# Altium project ElettronicaDiControllo.PrjPcb
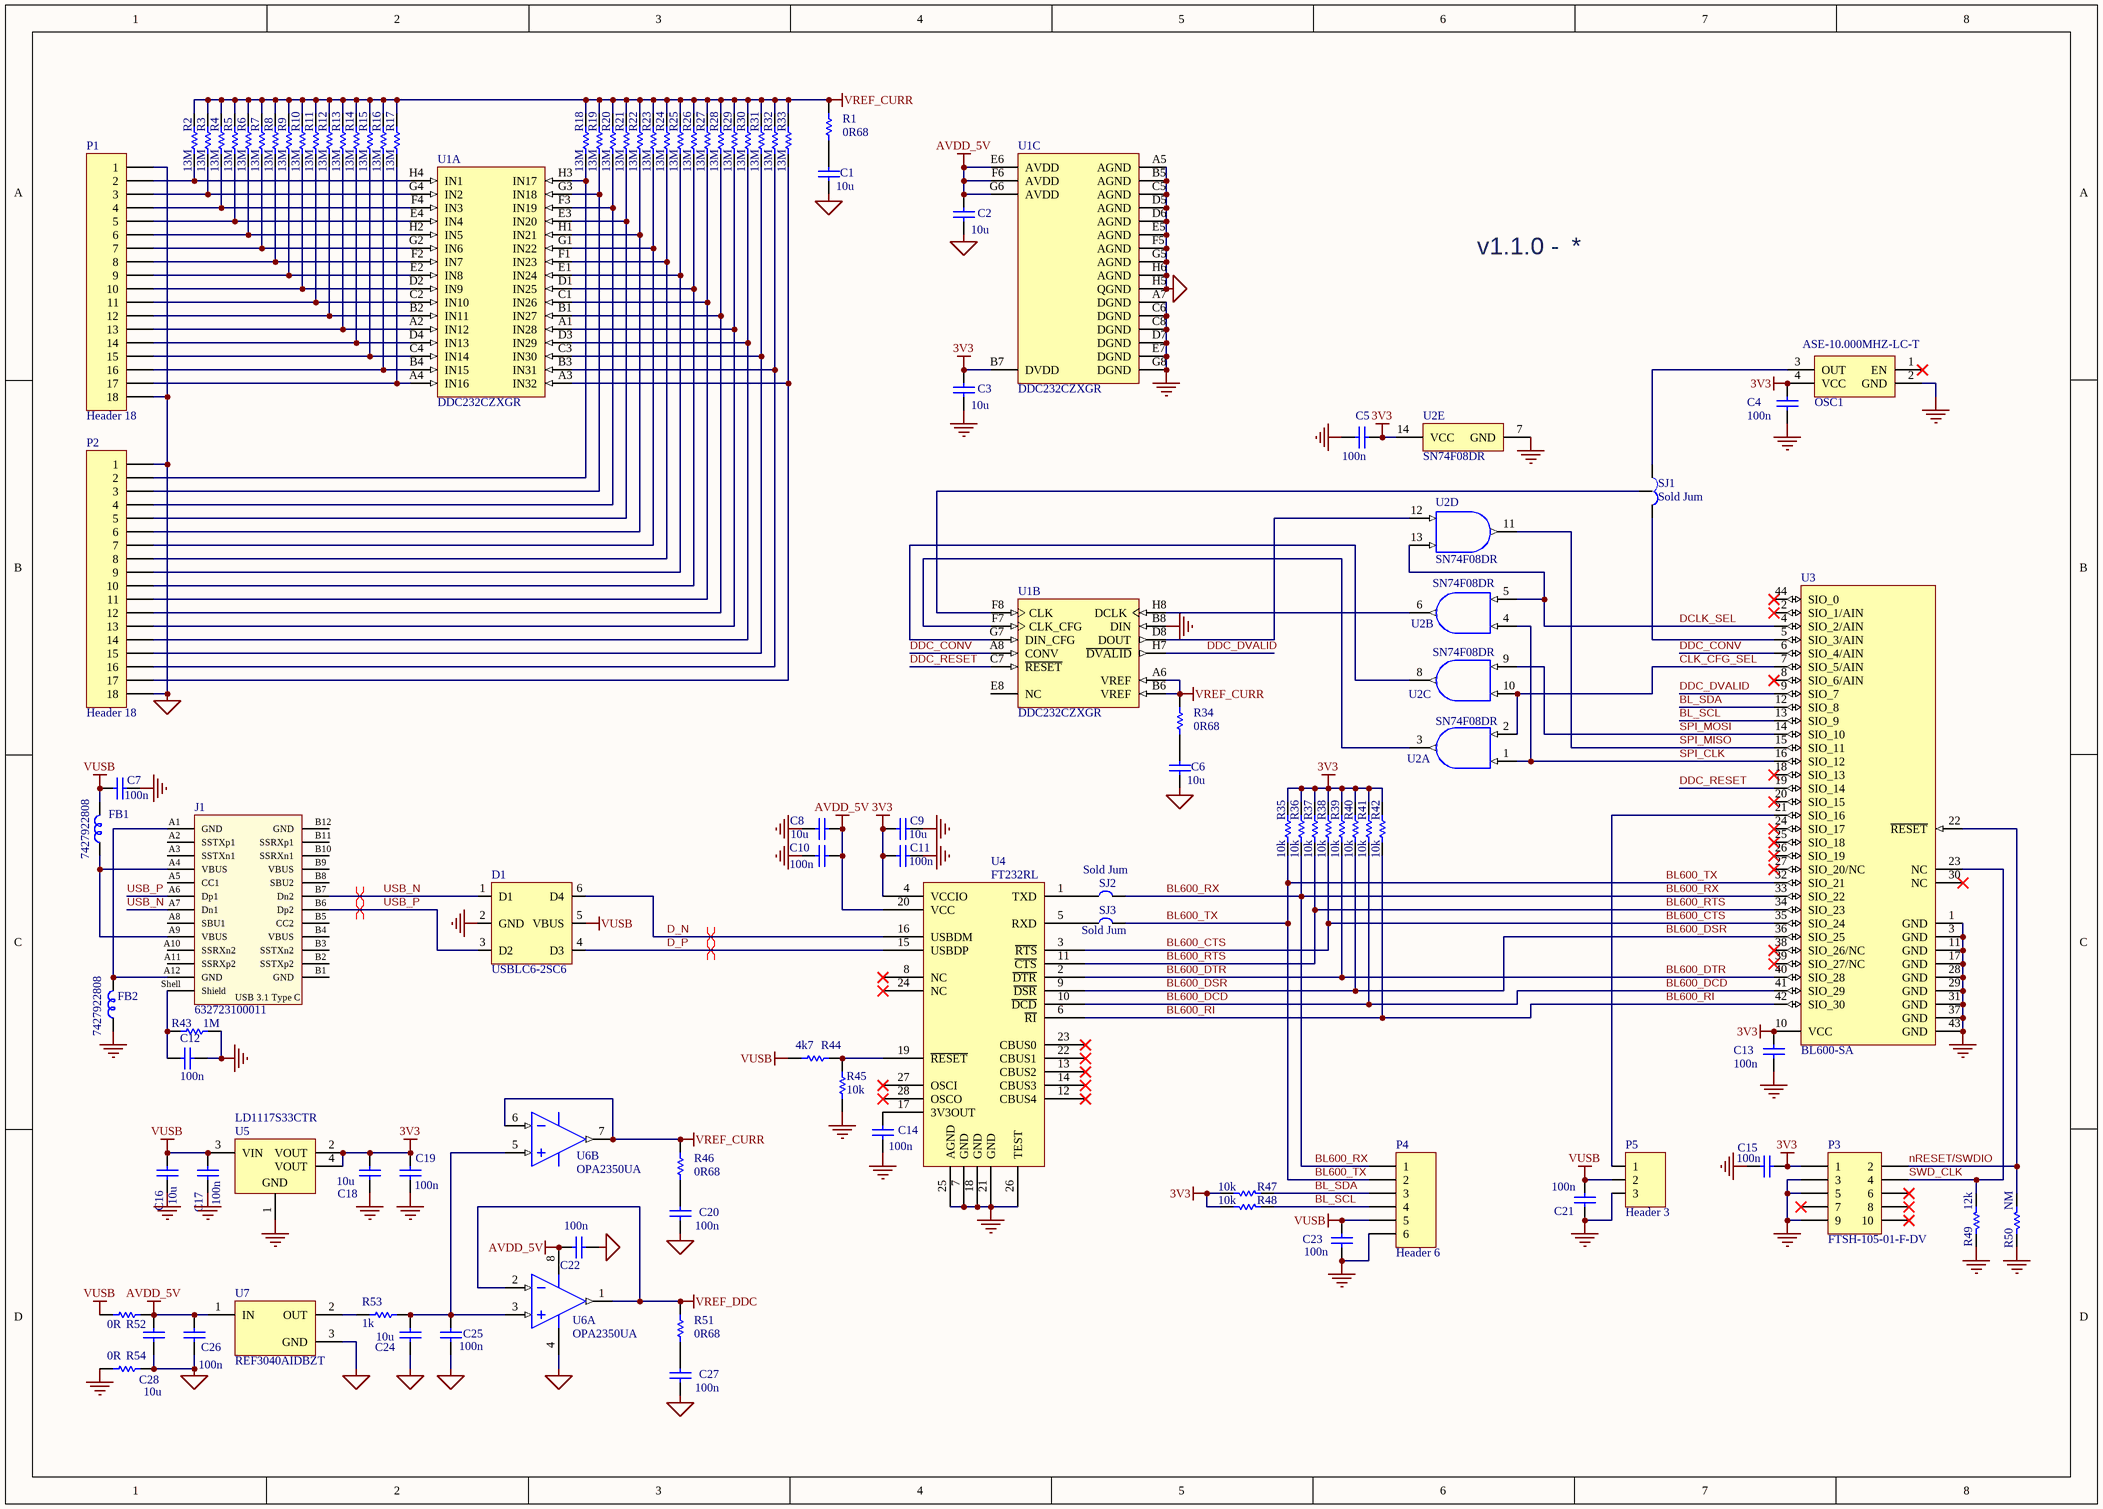
[diagram p0: ElettronicaDiControllo.SchDoc]
1 sheet, 102 parts. Net scope: global (net labels, ports and power ports of the same name join across sheets).

## Sheet ElettronicaDiControllo.SchDoc
size A3

### Parts
C1  10u  [0603]
C2  10u  [0603]
C3  10u  [0603]
C4  100n  [0603]
C5  100n  [0603]
C6  10u  [0603]
C7  100n  [0603]
C8  10u  [0603]
C9  10u  [0603]
C10  100n  [0603]
C11  100n  [0603]
C12  100n  [0603]
C13  100n  [0603]
C14  100n  [0603]
C15  100n  [0603]
C16  10u  [0603]
C17  100n  [0603]
C18  10u  [0603]
C19  100n  [0603]
C20  100n  [0603]
C21  100n  [0603]
C22  100n  [0603]
C23  100n  [0603]
C24  10u  [0603]
C25  100n  [0603]
C26  100n  [0603]
C27  100n  [0603]
C28  10u  [0603]
D1  USBLC6-2SC6  [SOT23-6]
FB1  7427922808  [0603]
FB2  7427922808  [0603]
J1  632723100011  [632723100011]
OSC1  ASE-10.000MHZ-LC-T  [XTAL_SMD3225]
P1  Header 18  [HDR1X18]
P2  Header 18  [HDR1X18]
P3  FTSH-105-01-F-DV  [FTSH-105-01-F-DV-K]
P4  Header 6  [HDR1X6]
P5  Header 3  [HDR1X3]
R1  0R68  [0603]
R2  13M  [0603]
R3  13M  [0603]
R4  13M  [0603]
R5  13M  [0603]
R6  13M  [0603]
R7  13M  [0603]
R8  13M  [0603]
R9  13M  [0603]
R10  13M  [0603]
R11  13M  [0603]
R12  13M  [0603]
R13  13M  [0603]
R14  13M  [0603]
R15  13M  [0603]
R16  13M  [0603]
R17  13M  [0603]
R18  13M  [0603]
R19  13M  [0603]
R20  13M  [0603]
R21  13M  [0603]
R22  13M  [0603]
R23  13M  [0603]
R24  13M  [0603]
R25  13M  [0603]
R26  13M  [0603]
R27  13M  [0603]
R28  13M  [0603]
R29  13M  [0603]
R30  13M  [0603]
R31  13M  [0603]
R32  13M  [0603]
R33  13M  [0603]
R34  0R68  [0603]
R35  10k  [0603]
R36  10k  [0603]
R37  10k  [0603]
R38  10k  [0603]
R39  10k  [0603]
R40  10k  [0603]
R41  10k  [0603]
R42  10k  [0603]
R43  1M  [0603]
R44  4k7  [0603]
R45  10k  [0603]
R46  0R68  [0603]
R47  10k  [0603]
R48  10k  [0603]
R49  12k  [0603]
R50  NM  [0603]
R51  0R68  [0603]
R52  0R  [0603]
R53  1k  [0603]
R54  0R  [0603]
SJ1  Sold Jum  [Solder_j2]
SJ2  Sold Jum  [Solder_j]
SJ3  Sold Jum  [Solder_j]
U1  DDC232CZXGR  [TI-ZXG64]  (parts A,B,C of 3)
U2  SN74F08DR  [D0014A_N]  (parts A,B,C,D,E of 5)
U3  BL600-SA  [LIRD-BL600-SA_V]
U4  FT232RL  [TSSOP28-W]
U5  LD1117S33CTR  [SOT-223_N]
U6  OPA2350UA  [D0008A_L]  (parts A,B of 2)
U7  REF3040AIDBZT  [DBZ0003A_M]

### Nets
3V3: C3.2 C4.1 C5.2 C9.1 C11.1 C13.1 C15.1 C18.1 C19.1 OSC1.4(VCC) P3.1 R35.2 R36.2 R37.2 R38.2 R39.2 R40.2 R41.2 R42.2 R47.2 R48.2 U1.B7(DVDD) U2.14(VCC) U3.10(VCC) U4.4(VCCIO) U5.2(VOUT) U5.4(VOUT)
AGND: C1.2 C2.1 C6.2 C20.2 C22.2 C24.2 C25.2 C26.2 C27.2 C28.2 P1.1 P1.18 P2.1 P2.18 R54.1 U1.A5(AGND) U1.B5(AGND) U1.C5(AGND) U1.D5(AGND) U1.D6(AGND) U1.E5(AGND) U1.F5(AGND) U1.G5(AGND) U1.H5(QGND) U1.H6(AGND) U6.4(V-) U7.3(GND)
AVDD_5V: C2.2 C8.1 C10.1 C22.1 C26.1 C28.1 R52.1 U1.E6(AVDD) U1.F6(AVDD) U1.G6(AVDD) U4.20(VCC) U6.8(V+) U7.1(IN)
GND: C3.1 C4.2 C5.1 C7.2 C8.2 C9.2 C10.2 C11.2 C12.2 C13.2 C14.1 C15.2 C16.2 C17.2 C18.2 C19.2 C21.2 C23.2 D1.2(GND) FB2.2 OSC1.2(GND) P3.3 P3.5 P3.9 P4.6 P5.3 R43.1 R45.2 R49.2 R50.2 R54.2 U1.A7(DGND) U1.B8(DIN) U1.C6(DGND) U1.C8(DGND) U1.D7(DGND) U1.E7(DGND) U1.G8(DGND) U2.7(GND) U3.1(GND) U3.3(GND) U3.11(GND) U3.17(GND) U3.28(GND) U3.29(GND) U3.31(GND) U3.37(GND) U3.43(GND) U4.7(GND) U4.18(GND) U4.21(GND) U4.25(AGND) U4.26(TEST) U5.1(GND)
VREF_CURR: R1.2 R2.2 R3.2 R4.2 R5.2 R6.2 R7.2 R8.2 R9.2 R10.2 R11.2 R12.2 R13.2 R14.2 R15.2 R16.2 R17.2 R18.2 R19.2 R20.2 R21.2 R22.2 R23.2 R24.2 R25.2 R26.2 R27.2 R28.2 R29.2 R30.2 R31.2 R32.2 R33.2 R34.2 R46.2 U1.A6(VREF) U1.B6(VREF) U6.6(IN_B-) U6.7(OUT_B)
VREF_DDC: R51.2 U6.1(OUT_A) U6.2(IN_A-)
VUSB: C7.1 C16.1 C17.1 C21.1 C23.1 D1.5(VBUS) FB1.1 P4.5 P5.2 R44.2 R52.2 U5.3(VIN)
BL600_CTS: R38.1 U3.35(SIO_24) U4.3(~{RTS})
BL600_DCD: R41.1 U3.41(SIO_29) U4.10(~{DCD})
BL600_DSR: R40.1 U3.36(SIO_25) U4.9(~{DSR})
BL600_DTR: R39.1 U3.40(SIO_28) U4.2(~{DTR})
BL600_RI: R42.1 U3.42(SIO_30) U4.6(~{RI})
BL600_RTS: R37.1 U3.34(SIO_23) U4.11(~{CTS})
BL600_RX: P4.1 R36.1 SJ2.1 U3.33(SIO_22)
BL600_TX: P4.2 R35.1 SJ3.1 U3.32(SIO_21)
BL_SCL: P4.4 R48.1 U3.13(SIO_9)
BL_SDA: P4.3 R47.1 U3.12(SIO_8)
CLK_CFG_SEL: U2.2(1B) U2.10(3B) U3.7(SIO_5/AIN)
D_N: D1.6(D4) U4.16(USBDM)
D_P: D1.4(D3) U4.15(USBDP)
DCLK_SEL: U2.5(2B) U2.13(4B) U3.4(SIO_2/AIN)
DDC_CONV: U1.A8(CONV) U3.6(SIO_4/AIN)
DDC_DVALID: U1.H7(~{DVALID}) U3.9(SIO_7)
DDC_RESET: U1.C7(~{RESET}) U3.19(SIO_14)
nRESET/SWDIO: P3.2 R50.1 U3.22(~{RESET})
SPI_CLK: U2.1(1A) U2.4(2A) U3.16(SIO_12)
SPI_MISO: U2.11(4Y) U3.15(SIO_11)
SPI_MOSI: U2.9(3A) U3.14(SIO_10)
SWD_CLK: P3.4 R49.1 U3.23(NC)
USB_N: D1.1(D1) J1.A7(Dn1) J1.B7(Dn2)
USB_P: D1.3(D2) J1.A6(Dp1) J1.B6(Dp2)
NetC1_1: C1.1 R1.1
NetC6_1: C6.1 R34.1
NetC12_1: C12.1 J1.Shell(Shield) R43.2
NetC14_2: C14.2 U4.17(3V3OUT)
NetC20_1: C20.1 R46.1
NetC24_1: C24.1 C25.1 R53.1 U6.3(IN_A+) U6.5(IN_B+)
NetC27_1: C27.1 R51.1
NetFB1_2: FB1.2 J1.A4(VBUS) J1.A9(VBUS)
NetFB2_1: FB2.1 J1.A1(GND) J1.A12(GND)
NetOSC1_3: OSC1.3(OUT) SJ1.3
NetP1_2: P1.2 R2.1 U1.H4(IN1)
NetP1_3: P1.3 R3.1 U1.G4(IN2)
NetP1_4: P1.4 R4.1 U1.F4(IN3)
NetP1_5: P1.5 R5.1 U1.E4(IN4)
NetP1_6: P1.6 R6.1 U1.H2(IN5)
NetP1_7: P1.7 R7.1 U1.G2(IN6)
NetP1_8: P1.8 R8.1 U1.F2(IN7)
NetP1_9: P1.9 R9.1 U1.E2(IN8)
NetP1_10: P1.10 R10.1 U1.D2(IN9)
NetP1_11: P1.11 R11.1 U1.C2(IN10)
NetP1_12: P1.12 R12.1 U1.B2(IN11)
NetP1_13: P1.13 R13.1 U1.A2(IN12)
NetP1_14: P1.14 R14.1 U1.D4(IN13)
NetP1_15: P1.15 R15.1 U1.C4(IN14)
NetP1_16: P1.16 R16.1 U1.B4(IN15)
NetP1_17: P1.17 R17.1 U1.A4(IN16)
NetP2_2: P2.2 R18.1 U1.H3(IN17)
NetP2_3: P2.3 R19.1 U1.G3(IN18)
NetP2_4: P2.4 R20.1 U1.F3(IN19)
NetP2_5: P2.5 R21.1 U1.E3(IN20)
NetP2_6: P2.6 R22.1 U1.H1(IN21)
NetP2_7: P2.7 R23.1 U1.G1(IN22)
NetP2_8: P2.8 R24.1 U1.F1(IN23)
NetP2_9: P2.9 R25.1 U1.E1(IN24)
NetP2_10: P2.10 R26.1 U1.D1(IN25)
NetP2_11: P2.11 R27.1 U1.C1(IN26)
NetP2_12: P2.12 R28.1 U1.B1(IN27)
NetP2_13: P2.13 R29.1 U1.A1(IN28)
NetP2_14: P2.14 R30.1 U1.D3(IN29)
NetP2_15: P2.15 R31.1 U1.C3(IN30)
NetP2_16: P2.16 R32.1 U1.B3(IN31)
NetP2_17: P2.17 R33.1 U1.A3(IN32)
NetP5_1: P5.1 U3.21(SIO_16)
NetR44_1: R44.1 R45.1 U4.19(~{RESET})
NetR53_2: R53.2 U7.2(OUT)
NetSJ1_1: SJ1.1 U3.5(SIO_3/AIN)
NetSJ1_2: SJ1.2 U1.F8(CLK)
NetSJ2_2: SJ2.2 U4.1(TXD)
NetSJ3_2: SJ3.2 U4.5(RXD)
NetU1_D8: U1.D8(DOUT) U2.12(4A)
NetU1_F7: U1.F7(CLK_CFG) U2.3(1Y)
NetU1_G7: U1.G7(DIN_CFG) U2.8(3Y)
NetU1_H8: U1.H8(DCLK) U2.6(2Y)

Not connected (* = marked no-connect by the designer): J1 A2(SSTXp1) A3(SSTXn1) A5(CC1) A8(SBU1) A10(SSRXn2) A11(SSRXp2) B1(GND) B2(SSTXp2) B3(SSTXn2) B4(VBUS) B5(CC2) B8(SBU2) B9(VBUS) B10(SSRXn1) B11(SSRXp1) B12(GND); OSC1 1(EN)*; P3 6* 7* 8* 10*; U1 E8(NC); U3 2(SIO_1/AIN)* 8(SIO_6/AIN)* 18(SIO_13)* 20(SIO_15)* 24(SIO_17)* 25(SIO_18)* 26(SIO_19)* 27(SIO_20/NC)* 30(NC)* 38(SIO_26/NC)* 39(SIO_27/NC)* 44(SIO_0)*; U4 8(NC)* 12(CBUS4)* 13(CBUS2)* 14(CBUS3)* 22(CBUS1)* 23(CBUS0)* 24(NC)* 27(OSCI)* 28(OSCO)*

### Layout directives
differential pair: D_N, D_P, USB_N, USB_P

### Notes on the sheet
- v1.1.0 -
- (in symbol 632723100011) USB 3.1 Type C

### Library data of the parts
C1-C28 = Cap 100nF: Capacitor; Published: 8-Jun-2000; LatestRevisionDate: 17-Jul-2002; LatestRevisionNote: Re-released for DXP Platform.; Publisher: Altium Limited
D1 = USBUF02W6: EMI filter and line termination for USB upstream ports; Supplier 1: Digi-Key; Supplier Part Number 1: 497-5235-1-ND; Supplier 2: Farnell; Supplier Part Number 2: 1269406
FB1 FB2 = Ferrite: Supplier 1: Digi-Key; Supplier Part Number 1: 732-6114-1-ND; Supplier 2: Farnell; Supplier Part Number 2: 2467183
J1 = 632723100011: USB 3.1 Type C Receptacle Horizontal THR WR-COM; Interface Type: Type C; Sub-Family: USB 3.1; ComponentLink1Description: Manufacturer; ComponentLink1URL: http://www.we-online.de; ComponentLink2Description: Datasheet; ComponentLink2URL: http://katalog.we-online.de/em/datasheet/632723x00011.pdf; Part Number: 632723100011; Published Date: April 2017; Publisher: Wurth Elektronik; Gender: Receptacle; Type: Horizontal; Construction: THR; Supplier 1: Digi-Key; Supplier 2: Farnell; Supplier Part Number 1: 732-9617-1-ND; Supplier Part Number 2: 2984360
OSC1 = Oscillatore: Supplier 1: Digi-Key; Supplier Part Number 1: 535-9559-1-ND; Supplier 2: Mouser; Supplier Part Number 2: 815-ASE10.000MHZLCT
P1 P2 = Header 18: Header, 18-Pin; LatestRevisionDate: 17-Jul-2002; LatestRevisionNote: Re-released for DXP Platform.; Publisher: Altium Limited
P3 = Header 5X2: Header, 5-Pin, Dual row; LatestRevisionDate: 17-Jul-2002; LatestRevisionNote: Re-released for DXP Platform.; Publisher: Altium Limited; Supplier 1: Digi-Key; Supplier Part Number 1: SAM13159CT-ND; Supplier 2: Mouser; Supplier Part Number 2: 200-FTSH10501FDVKPTR
P4 = Header 6: Header, 6-Pin; LatestRevisionDate: 17-Jul-2002; LatestRevisionNote: Re-released for DXP Platform.; Publisher: Altium Limited
P5 = Header 3: Non Montare; LatestRevisionDate: 17-Jul-2002; LatestRevisionNote: Re-released for DXP Platform.; Publisher: Altium Limited
R1-R42 R44-R48 R51-R54 = Res 1M: Resistor; Value: 1M; Published: 8-Jun-2000; Publisher: Altium Limited; LatestRevisionDate: 17-Jul-2002; LatestRevisionNote: Re-released for DXP Platform.; PackageReference: AXIAL-0.3; PackageDescription: Axial Device, Thru-Hole; 2 Leads; 0.3 in Pin Spacing
R43 = Res 1M: Resistor; Published: 8-Jun-2000; Publisher: Altium Limited; Value: 1M; LatestRevisionDate: 17-Jul-2002; LatestRevisionNote: Re-released for DXP Platform.; PackageReference: AXIAL-0.3; PackageDescription: Axial Device, Thru-Hole; 2 Leads; 0.3 in Pin Spacing
R49 R50 = Res 0R: Resistor; Value: 0; Fitted: NO; Published: 8-Jun-2000; Revision: July-2002: Re-released for DXP Platform.; Publisher: Altium Limited
SJ1 = SJ2: Double solder jumper
SJ2 SJ3 = SJ: Solder Jumper
U1 = CMP-0003-02178-1: 32 Channel Current-Input 20-Bit ADC, 0 to 70 degC, 64-pin BGA (ZXG64), Green (RoHS & no Sb/Br); Manufacturer: Texas Instruments; Resolution(Bits): 20; Analog Voltage AV/DD(Max)(V): 5.25; Digital Supply(Max)(V): 3.6; Architecture: Delta-Sigma; Digital Supply(Min)(V): 2.7; Sample Rate (max)(SPS): 3.125k; # Input Channels: 32; SubFamily: Low Power, 8-Bit, Dual 1.5 GSPS or Single 3.0 GSPS A/D Converter; Analog Voltage AV/DD(Min)(V): 4.75; ComponentLink3URL: http://www.ti.com/litv/pdf/mpbg581; ComponentLink1URL: http://www.ti.com/; ComponentLink2Description: Datasheet; PackageDescription: 64-Pin Plastic Ball Grid Array, Body 8 x 8 mm, Pitch 0.8 mm; ComponentLink2URL: http://www.ti.com/general/docs/lit/getliterature.tsp?genericPartNumber=DDC232&fileType=pdf; PartNumber: DDC232CZXGR; Eco-Plan: Green (RoHS & no Sb/Br); Mounting Technology: Surface Mount; PackageVersion: 4206838/A, 02/2005; PackageReference: ZXG64; ComponentLink1Description: Manufacturer URL; DatasheetVersion: SBAS331D; ComponentLink3Description: Package Specification
U2 = CMP-0777-00012-3: Quadruple 2-Input Positive-AND Gate, D0014A, LARGE T&R; Manufacturer: Texas Instruments; Output Drive (IOL/IOH)(Max)(mA): -9/9; Bits(#): 4; tpd @ Nom Voltage(Max)(ns): 6.6; VCC(Min)(V): 4.5; F @ Nom Voltage(Max)(Mhz): 70; Input Type: TTL; Rating: Catalog; Technology Family: F; Voltage(Nom)(V): 5; Schmitt Trigger: No; VCC(Max)(V): 5.5; DatasheetVersion: SDFS038A; Operating Temperature Range(C): 0 to 70; PackageReference: D0014A; Generic Part Number: SN74F08; Output Type: TTL
U3 = CMP-2000-05951-1: Single Mode Bluetooth Low Energy (BLE) Module Integrated Antenna, 1.8 to 3.6 V, -25 to 75 degC, 44-Pin SMD, RoHS, Tray; Manufacturer: Laird; Bluetooth Version: Bluetooth4.0; Data Rate: 1Mbps; Supply Voltage Max: 3.6V; Supply Voltage Min: 1.8V; SVHC: NoSVHC(17-Dec-2014); Product Range: BL600Series; Receive Sensitivity: -91dBm; Signal Range Max: 100m; Bluetooth Class: Class2; Package Reference: BL600-SA; Datasheet Version: Rev. 3.0, 04/2015; Operating Temperature Max: 75°C; Operating Temperature Min: -25°C; Datasheet URL: http://cdn.lairdtech.com/home/brandworld/files/BL600%20Hardware%20Integration%20Guide.pdf; Package Description: 44-Pin Surface Mount Device, Body 19 x 12.5 mm, Pitch 0.8 mm, Height 3.27 mm; Manufacturer URL: https://www.lairdtech.com/; Mounting Technology: SurfaceMount
U4 = FT232R: USB  to  serial  UART   interface; Supplier 1: Digi-Key; Supplier Part Number 1: 768-1007-1-ND; Supplier 2: Farnell; Supplier Part Number 2: 1146032
U5 = CMP-0244-00307-1: Fixed Low Drop Positive Voltage Regulator, 3.3V, 4-Pin SOT-223, Tape and Reel; ComponentLink1URL: http://www.st.com; PackageVersion: 2010; ComponentLink1Description: Manufacturer URL; DatasheetVersion: 1/11/2011; ComponentLink2URL: http://www.st.com/internet/com/TECHNICAL_RESOURCES/TECHNICAL_LITERATURE/DATASHEET/CD00000544.pdf; PackageReference: SOT-223; ComponentLink2Description: Datasheet; PackageDescription: 4-Pin SOT-223 Package, 6.5 x 3.5 mm Body, 2.3 mm Pitch, 7 mm Lead Span
U6 = CMP-0272-00729-3: High-Speed, Single-Supply, Rail-to-Rail Operational Amplifier MicroAmplifier(TM) Series, 2.7 to 5.5 V, -40 to 85 degC, 8-pin SOIC (D8), Green (RoHS & no Sb/Br); Manufacturer: Texas Instruments; Number of Channels: 2; Vio (25C)(Max)(mV): 1; Iq per channel(Max)(mA): 8.5; Total Supply Voltage(Min)(+5V is 5, +/-5V is 10): 2.7; Vn at 1kHz(Typ)(nV/rtHz): 18; IIB(Max)(pA): 10; Total Supply Voltage(Max)(+5V is 5, +/-5V is 10): 5.5; Sub Family: Low Input Bias Current Amp (<=10pA), Low Offset Voltage Amplifier (<=500uV), Low Supply Voltage Amplifier (<=2.7V), Precision Amplifier; Offset Drift(Typ)(uV/C): 4; CMRR(Min)(dB): 74; Slew Rate(Typ)(V/us): 22; Mounting Technology: Surface Mount; Eco-Plan: Green (RoHS & no Sb/Br); ComponentLink2URL: http://www.ti.com/general/docs/lit/getliterature.tsp?genericPartNumber=OPA2350&fileType=pdf; ComponentLink3URL: http://www.ti.com/litv/pdf/msoi002j; PackageDescription: 8-Pin Plastic Small Outline, Body 4.9 x 3.9 mm, Pitch 1.27 mm; PackageReference: D0008A; Code_JEDEC: MS-012; ComponentLink2Description: Datasheet; DatasheetVersion: SBOS099C; ComponentLink3Description: Package Specification; ComponentLink1Description: Manufacturer URL; PartNumber: OPA2350UA; PackageVersion: 4040047-3/M, 06/2011; ComponentLink1URL: http://www.ti.com/
U7 = CMP-0367-00163-2: 4.096 V, 50 ppm / degC, 50 uA Series (Bandgap) Voltage Reference, -40 to 125 degC, 3-pin SOT-23 (DBZ), Green (RoHS & no Sb/Br); Manufacturer: Texas Instruments; Temp Coeff(Max)(ppm/ degree C): 50; SubFamily: Series Voltage Reference; Temp Coeff(Typ)(ppm/ degree C): 20; Initial Accuracy @ 25/deg C(%): 0.2; VI(Max)(V): 5.5; VO(V): 4.096; VI(Min)(V): 4.097; Rating: Catalog; PartNumber: REF3040AIDBZT; ComponentLink3Description: Package Specification; Iq(Max)(uA): 50; PackageVersion: 4203227/B; DatasheetVersion: SBVS032F; PackageReference: DBZ0003A; ComponentLink1URL: http://www.ti.com/; PackageDescription: 3-Pin Plastic Small Outline, Body 2.92 x 1.3 mm, Pitch 0.95 mm; Mounting Technology: Surface Mount; Eco-Plan: Green (RoHS & no Sb/Br); ComponentLink2URL: http://www.ti.com/general/docs/lit/getliterature.tsp?genericPartNumber=REF3040&fileType=pdf; Code_JEDEC: TO-236; ComponentLink1Description: Manufacturer URL; ComponentLink3URL: http://www.ti.com/litv/pdf/mpds108a; ComponentLink2Description: Datasheet